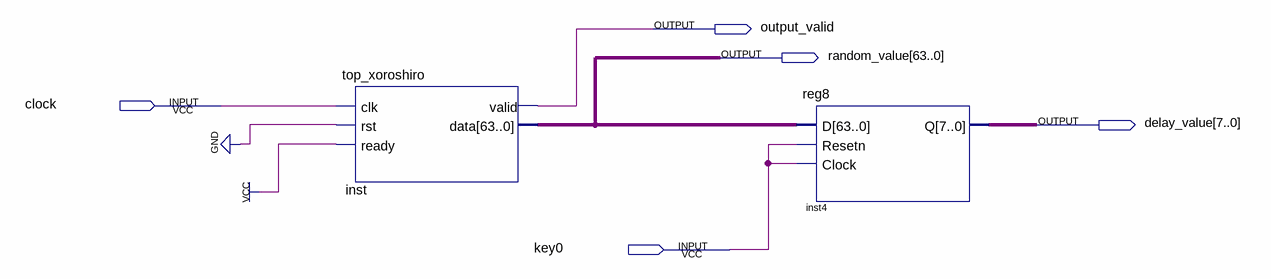
[diagram p0: schematic sheet]
// Quartus schematic PRNG.bdf as structural Verilog: 2 symbols, 5 pins
module PRNG (
  input  clock,
  input  key0,
  output output_valid,
  output [63:0] random_value,
  output [7:0] delay_value
);

  top_xoroshiro inst (.clk(clock), .rst(1'b0), .ready(1'b1), .valid(output_valid), .data(random_value));
  reg8 inst4 (.D(random_value), .Resetn(key0), .Clock(key0), .Q(delay_value));
endmodule
